# EasyEDA Pro project travellium-12v-desktop-power-supply-cc8d8467.epro, schematic LM5143
Board Name: LM5143; Create Date: 2025-01-03; Page Name: LM5143_SCH; Project Name: 12V桌面电源; Schematic Name: LM5143; Update Date: 2025-03-15; Company: 嘉立创EDA; Page Size: A3; Version: V1.0
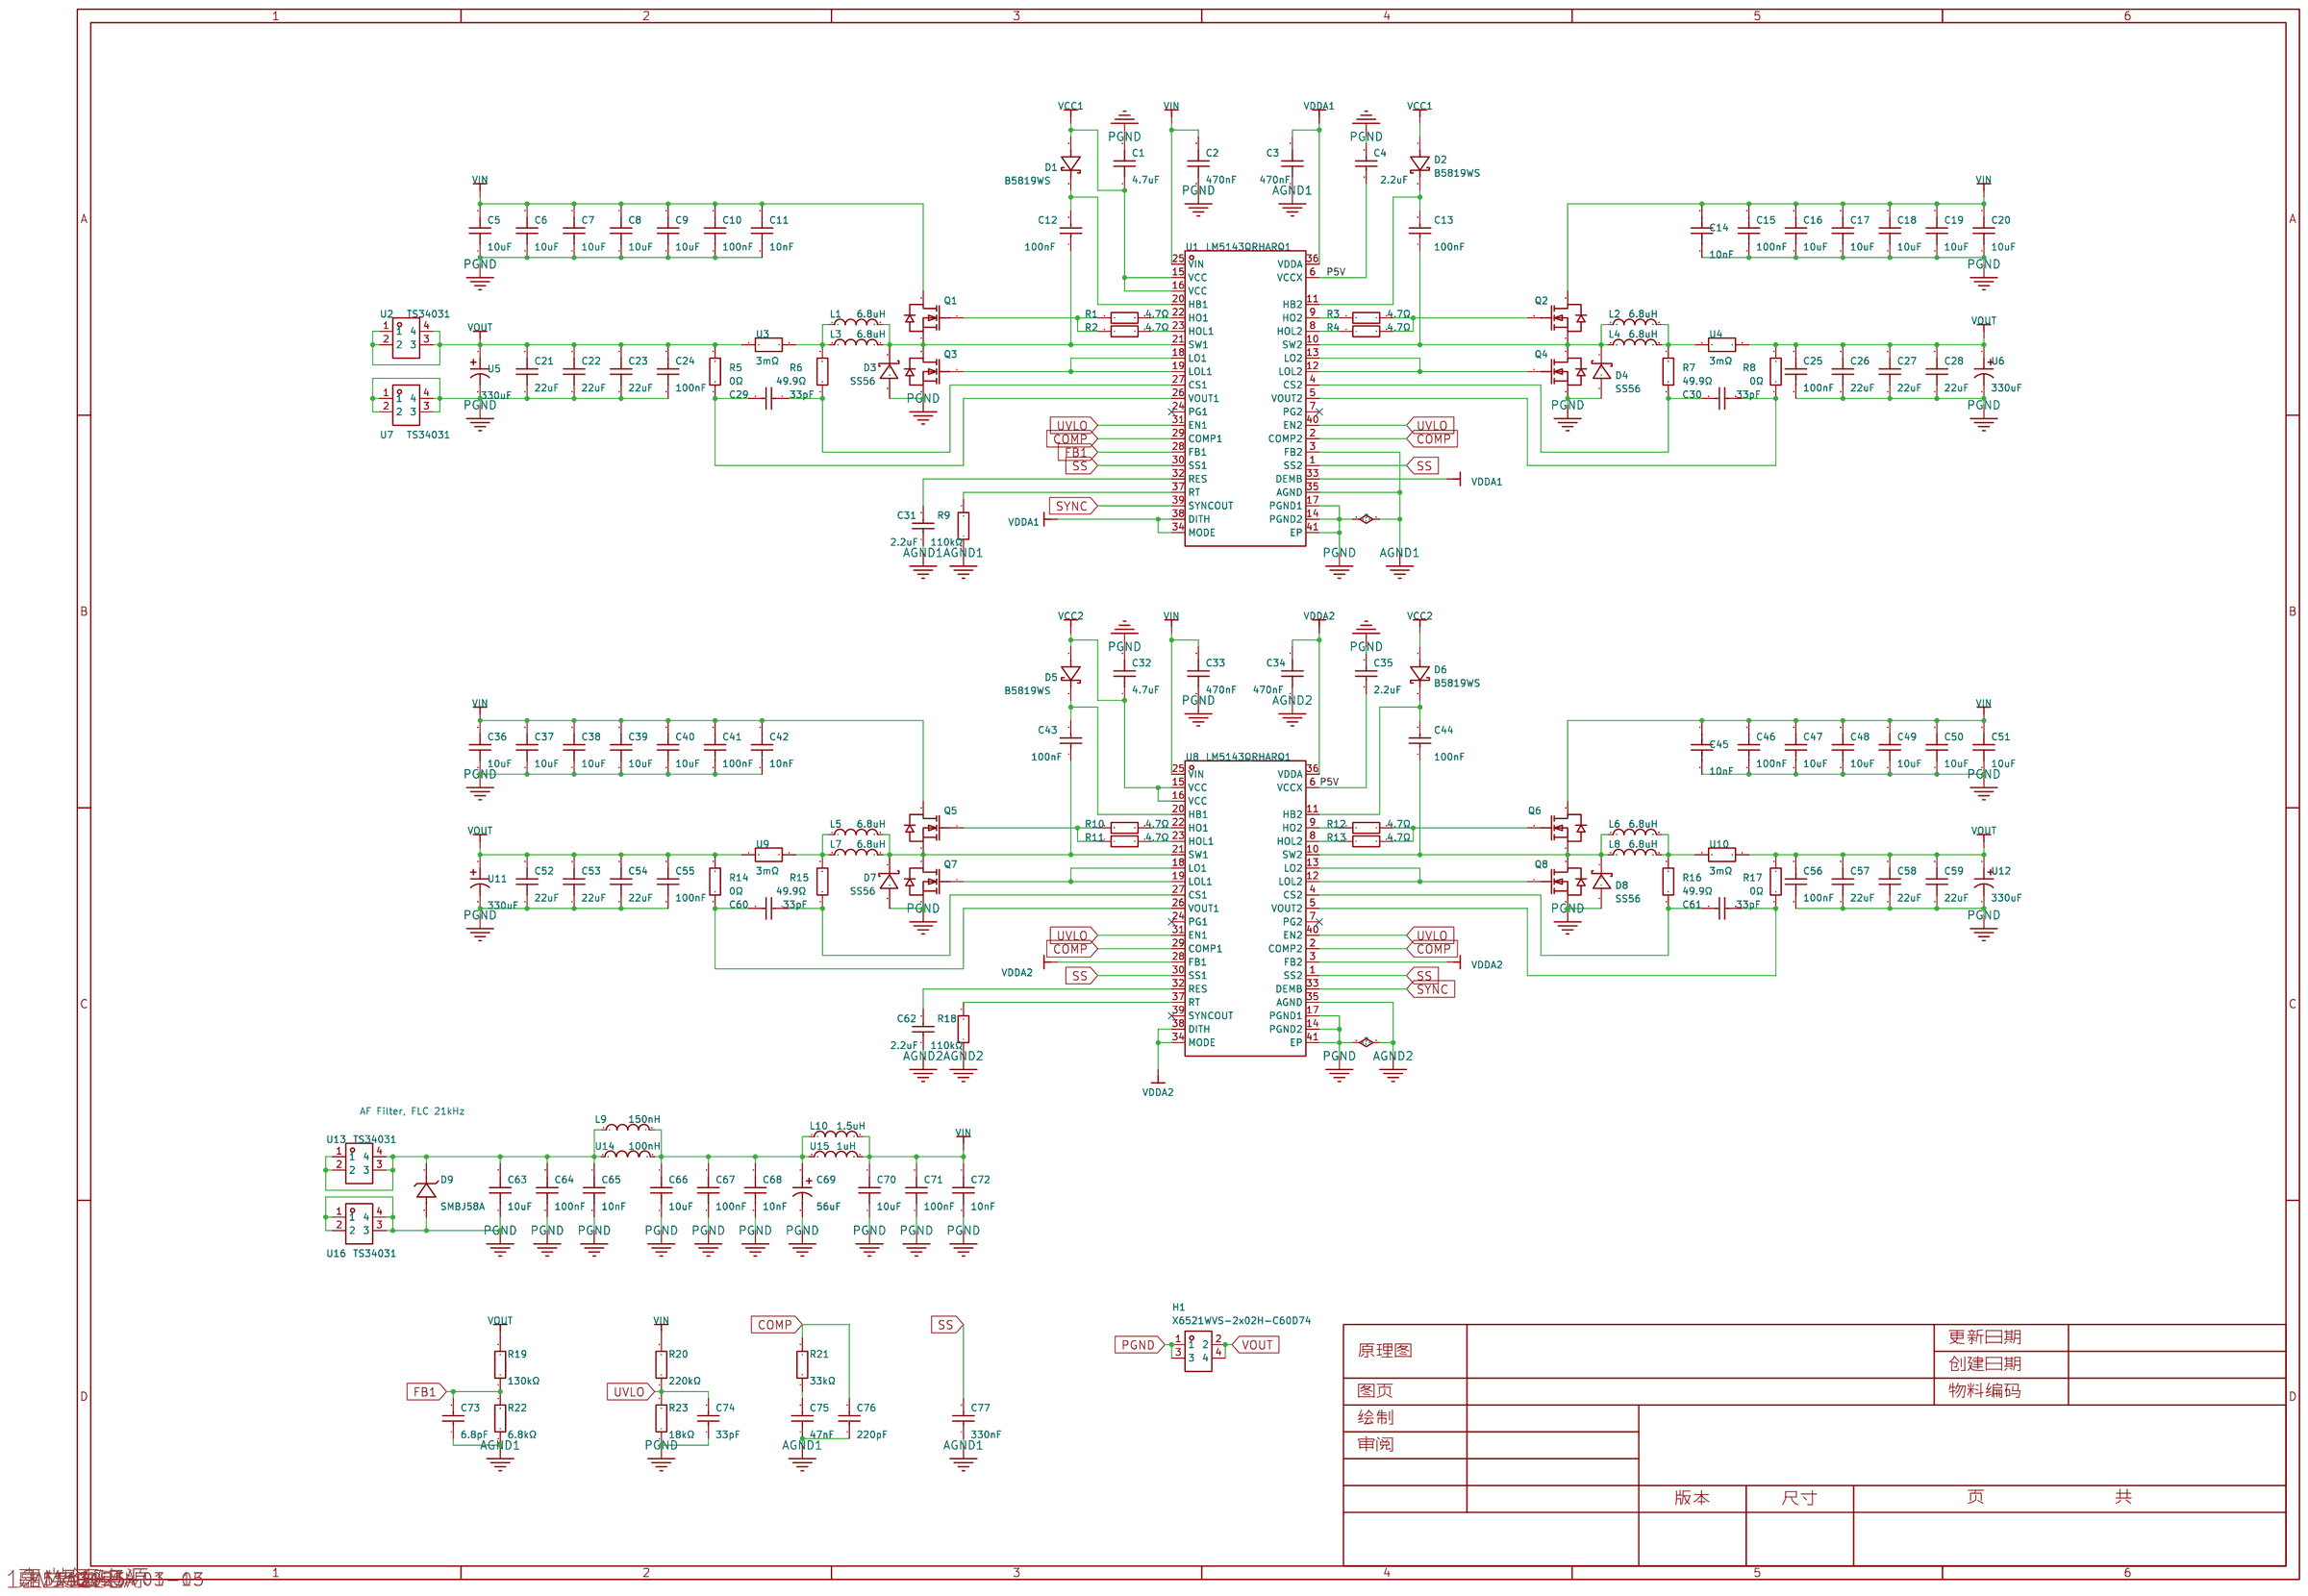
[diagram p3: schematic sheet]

## Parts
C1  4.7uF  [C0603]
C2  470nF  [CAP-SMD_L1.6-W0.8-3]
C3  470nF  [CAP-SMD_L1.6-W0.8-3]
C4  2.2uF  [C0603]
C5  10uF  [C1210]
C6  10uF  [C1210]
C7  10uF  [C1210]
C8  10uF  [C1210]
C9  10uF  [C1210]
C10  100nF  [C0805]
C11  10nF  [C0805]
C12  100nF  [C0603]
C13  100nF  [C0603]
C14  10nF  [C0805]
C15  100nF  [C0805]
C16  10uF  [C1210]
C17  10uF  [C1210]
C18  10uF  [C1210]
C19  10uF  [C1210]
C20  10uF  [C1210]
C21  22uF  [C1210]
C22  22uF  [C1210]
C23  22uF  [C1210]
C24  100nF  [C0805]
C25  100nF  [C0805]
C26  22uF  [C1210]
C27  22uF  [C1210]
C28  22uF  [C1210]
C29  33pF  [C0603]
C30  33pF  [C0603]
C31  2.2uF  [C0603]
C32  4.7uF  [C0603]
C33  470nF  [CAP-SMD_L1.6-W0.8-3]
C34  470nF  [CAP-SMD_L1.6-W0.8-3]
C35  2.2uF  [C0603]
C36  10uF  [C1210]
C37  10uF  [C1210]
C38  10uF  [C1210]
C39  10uF  [C1210]
C40  10uF  [C1210]
C41  100nF  [C0805]
C42  10nF  [C0805]
C43  100nF  [C0603]
C44  100nF  [C0603]
C45  10nF  [C0805]
C46  100nF  [C0805]
C47  10uF  [C1210]
C48  10uF  [C1210]
C49  10uF  [C1210]
C50  10uF  [C1210]
C51  10uF  [C1210]
C52  22uF  [C1210]
C53  22uF  [C1210]
C54  22uF  [C1210]
C55  100nF  [C0805]
C56  100nF  [C0805]
C57  22uF  [C1210]
C58  22uF  [C1210]
C59  22uF  [C1210]
C60  33pF  [C0603]
C61  33pF  [C0603]
C62  2.2uF  [C0603]
C63  10uF  [C1210]
C64  100nF  [C0805]
C65  10nF  [C0805]
C66  10uF  [C1210]
C67  100nF  [C0805]
C68  10nF  [C0805]
C69  56uF  [CAP-SMD_BD10.0-L10.3-W10.3-LS11.0-FD-1]
C70  10uF  [C1210]
C71  100nF  [C0805]
C72  10nF  [C0805]
C73  6.8pF  [C0603]
C74  33pF  [C0603]
C75  47nF  [C0603]
C76  220pF  [C0603]
C77  330nF  [C0603]
D1  B5819WS  [SOD-323_L1.7-W1.3-LS2.5-FD]
D2  B5819WS  [SOD-323_L1.7-W1.3-LS2.5-FD]
D3  SS56  [SMA_L4.3-W2.6-LS5.2-RD]
D4  SS56  [SMA_L4.3-W2.6-LS5.2-RD]
D5  B5819WS  [SOD-323_L1.7-W1.3-LS2.5-FD]
D6  B5819WS  [SOD-323_L1.7-W1.3-LS2.5-FD]
D7  SS56  [SMA_L4.3-W2.6-LS5.2-RD]
D8  SS56  [SMA_L4.3-W2.6-LS5.2-RD]
D9  SMBJ58A  [SMB_L4.4-W3.6-LS5.3-RD]
H1  X6521WVS-2x02H-C60D74  [HDR-SMD_4P-P2.54-V-M-R2-C5-S7.4]
L1  6.8uH  [IND-SMD_L16.5-W15.5]
L2  6.8uH  [IND-SMD_L16.5-W15.5]
L3  6.8uH  [IND-SMD_L23.5-W22.0]
L4  6.8uH  [IND-SMD_L23.5-W22.0]
L5  6.8uH  [IND-SMD_L16.5-W15.5]
L6  6.8uH  [IND-SMD_L16.5-W15.5]
L7  6.8uH  [IND-SMD_L23.5-W22.0]
L8  6.8uH  [IND-SMD_L23.5-W22.0]
L9  150nH  [IND-SMD_L12.8-W8.0_FPIB130840]
L10  1.5uH  [IND-SMD_L17.5-W17.5]
Q1  CSD18563Q5A  [DFN-8_L5.7-W5.1-P1.27-LS6.0-BL]
Q2  CSD18563Q5A  [DFN-8_L5.7-W5.1-P1.27-LS6.0-BL]
Q3  CSD18563Q5A  [DFN-8_L5.7-W5.1-P1.27-LS6.0-BL]
Q4  CSD18563Q5A  [DFN-8_L5.7-W5.1-P1.27-LS6.0-BL]
Q5  CSD18563Q5A  [DFN-8_L5.7-W5.1-P1.27-LS6.0-BL]
Q6  CSD18563Q5A  [DFN-8_L5.7-W5.1-P1.27-LS6.0-BL]
Q7  CSD18563Q5A  [DFN-8_L5.7-W5.1-P1.27-LS6.0-BL]
Q8  CSD18563Q5A  [DFN-8_L5.7-W5.1-P1.27-LS6.0-BL]
R1  4.7Ω  [R0603]
R2  4.7Ω  [R0603]
R3  4.7Ω  [R0603]
R4  4.7Ω  [R0603]
R5  0Ω  [R0603]
R6  49.9Ω  [R0603]
R7  49.9Ω  [R0603]
R8  0Ω  [R0603]
R9  110kΩ  [R0603]
R10  4.7Ω  [R0603]
R11  4.7Ω  [R0603]
R12  4.7Ω  [R0603]
R13  4.7Ω  [R0603]
R14  0Ω  [R0603]
R15  49.9Ω  [R0603]
R16  49.9Ω  [R0603]
R17  0Ω  [R0603]
R18  110kΩ  [R0603]
R19  130kΩ  [R0603]
R20  220kΩ  [R0603]
R21  33kΩ  [R0603]
R22  6.8kΩ  [R0603]
R23  18kΩ  [R0603]
U1  LM5143QRHARQ1  [VQFN-40_L6.0-W6.0-P0.50-TL-EP3.3]
U2  TS34031  [CONN-SMD_TS34031]
U3  3mΩ  [R2512]
U4  3mΩ  [R2512]
U5  330uF  [CAP-SMD_BD10.0-L10.3-W10.3-LS10.9-FD]
U6  330uF  [CAP-SMD_BD10.0-L10.3-W10.3-LS10.9-FD]
U7  TS34031  [CONN-SMD_TS34031]
U8  LM5143QRHARQ1  [VQFN-40_L6.0-W6.0-P0.50-TL-EP3.3]
U9  3mΩ  [R2512]
U10  3mΩ  [R2512]
U11  330uF  [CAP-SMD_BD10.0-L10.3-W10.3-LS10.9-FD]
U12  330uF  [CAP-SMD_BD10.0-L10.3-W10.3-LS10.9-FD]
U13  TS34031  [CONN-SMD_TS34031]
U14  100nH  [IND-SMD_L7.1-W6.6]
U15  1uH  [IND-SMD_L17.5-W17.0_YXMAC1770]
U16  TS34031  [CONN-SMD_TS34031]

## Library data of the parts
C1 C32 = 0603X475K250NT: 容值:4.7uF;精度:±10%;额定电压:25V;材质(温度系数):X5R;; LCSC Part Name: 4.7uF ±10% 25V; Supplier Part: C2936640; Manufacturer: FH(风华); Supplier Footprint: 0603; JLCPCB Part Class: 扩展库; Datasheet: https://atta.szlcsc.com/upload/public/pdf/source/20211229/CBCEA01A18300571AA3BD7304DEDFA2D.pdf; Supplier: LCSC; Tolerance: ±10%; Voltage Rated: 25V; Temperature Coefficient: X5R
C2 C3 C33 C34 = CC0603KRX7R9BB474: 容值:470nF;精度:±10%;额定电压:50V;材质(温度系数):X7R;; LCSC Part Name: 470nF ±10% 50V; Supplier Part: C513577; Manufacturer: YAGEO(国巨); Supplier Footprint: 0603; JLCPCB Part Class: 扩展库; Datasheet: https://atta.szlcsc.com/upload/public/pdf/source/20200423/C519417_FF9998E3F66D767819CD86A66B468321.pdf; Supplier: LCSC; Tolerance: ±10%; Voltage Rated: 50V; Temperature Coefficient: X7R
C4 C31 C35 C62 = 0603B225K250NT: 容值:2.2uF;精度:±10%;额定电压:25V;材质(温度系数):X7R;; LCSC Part Name: 2.2uF ±10% 25V; Supplier Part: C99228; Manufacturer: FH(风华); Supplier Footprint: 0603; JLCPCB Part Class: 扩展库; Datasheet: https://atta.szlcsc.com/upload/public/pdf/source/20200305/C486355_26A10D38EF8C2A5C37091D0039909270.pdf; Supplier: LCSC; Tolerance: ±10%; Voltage Rated: 25V; Temperature Coefficient: X7R
C5-C9 C16-C20 C36-C40 C47-C51 C63 C66 C70 = FS32X106K101EGG: 容值:10uF;精度:±10%;额定电压:100V;材质(温度系数):X7R;; LCSC Part Name: 10uF ±10% 100V; Supplier Part: C5156756; Manufacturer: PSA(信昌电陶); Supplier Footprint: 1210; JLCPCB Part Class: 扩展库; Datasheet: https://atta.szlcsc.com/upload/public/pdf/source/20220906/2A42A90825742552985FFB5A7BAB200E.pdf; Supplier: LCSC; Tolerance: ±10%; Voltage Rated: 100V; Temperature Coefficient: X7R
C10 C15 C24 C25 C41 C46 C55 C56 C64 C67 C71 = 0805B104K101NT: 容值:100nF;精度:±10%;额定电压:100V;材质(温度系数):X7R;; LCSC Part Name: 100nF ±10% 100V; Supplier Part: C89258; Manufacturer: FH(风华); Supplier Footprint: 0805; JLCPCB Part Class: 扩展库; Datasheet: https://atta.szlcsc.com/upload/public/pdf/source/20200305/C486355_26A10D38EF8C2A5C37091D0039909270.pdf; Supplier: LCSC; Tolerance: ±10%; Voltage Rated: 100V; Temperature Coefficient: X7R
C11 C14 C42 C45 C65 C68 C72 = 0805B103K101NT: 容值:10nF;精度:±10%;额定电压:100V;材质(温度系数):X7R;; LCSC Part Name: 10nF ±10% 100V; Supplier Part: C128805; Manufacturer: FH(风华); Supplier Footprint: 0805; JLCPCB Part Class: 扩展库; Datasheet: https://atta.szlcsc.com/upload/public/pdf/source/20200305/C486355_26A10D38EF8C2A5C37091D0039909270.pdf; Supplier: LCSC; Tolerance: ±10%; Voltage Rated: 100V; Temperature Coefficient: X7R
C12 C13 C43 C44 = 0603B104K500NT: 容值:100nF;精度:±10%;额定电压:50V;材质(温度系数):X7R;; LCSC Part Name: 100nF ±10% 50V; Supplier Part: C30926; Manufacturer: FH(风华); Supplier Footprint: 0603; JLCPCB Part Class: 扩展库; Datasheet: https://atta.szlcsc.com/upload/public/pdf/source/20200305/C486355_26A10D38EF8C2A5C37091D0039909270.pdf; Supplier: LCSC; Tolerance: ±10%; Voltage Rated: 50V; Temperature Coefficient: X7R
C21-C23 C26-C28 C52-C54 C57-C59 = CGA1210X5R226K350RT: 容值:22uF;精度:±10%;额定电压:35V;材质(温度系数):X5R;; LCSC Part Name: 22uF ±10% 35V; Supplier Part: C6120016; Manufacturer: HRE(芯声); Supplier Footprint: 1210; JLCPCB Part Class: 扩展库; Datasheet: https://atta.szlcsc.com/upload/public/pdf/source/20240229/B394560356D0E8099C4BF336FC93CE67.pdf; Supplier: LCSC; Tolerance: ±10%; Voltage Rated: 35V; Temperature Coefficient: X5R
C29 C30 C60 C61 C74 = CC0603JRNPO9BN330: 容值:33pF;精度:±5%;额定电压:50V;材质(温度系数):NP0;; LCSC Part Name: 33pF ±5% 50V; Supplier Part: C107047; Manufacturer: YAGEO(国巨); Supplier Footprint: 0603; JLCPCB Part Class: 扩展库; Datasheet: https://atta.szlcsc.com/upload/public/pdf/source/20170914/C128857_1505359892143968080.pdf; Supplier: LCSC; Tolerance: ±5%; Voltage Rated: 50V; Temperature Coefficient: NP0
C69 = HV1J566M1010PZ: 容值:56uF;精度:±20%;额定电压:63V;; LCSC Part Name: 56uF ±20% 63V; Supplier Part: C5246569; Manufacturer: HONOR(荣誉); Supplier Footprint: SMD,D10xL10mm; JLCPCB Part Class: 扩展库; Datasheet: https://atta.szlcsc.com/upload/public/pdf/source/20240802/61683F5000C7CFED5606ABBE3CFBE0F5.pdf; Supplier: LCSC; Tolerance: ±20%; Voltage Rated: 63V; Diameter: 10mm; Height - Seated (Max): 10mm; Operating Temperature: -55℃~+105℃
C73 = 0603CG6R8C500NT: 容值:6.8pF;额定电压:50V;材质(温度系数):C0G;; LCSC Part Name: 6.8pF 50V; Supplier Part: C1679; Manufacturer: FH(风华); Supplier Footprint: 0603; JLCPCB Part Class: 扩展库; Datasheet: https://atta.szlcsc.com/upload/public/pdf/source/20200305/C486355_26A10D38EF8C2A5C37091D0039909270.pdf; Supplier: LCSC; Voltage Rated: 50V; Temperature Coefficient: C0G
C75 = CC0603KRX7R9BB473: 容值:47nF;精度:±10%;额定电压:50V;材质(温度系数):X7R;; LCSC Part Name: 47nF ±10% 50V; Supplier Part: C107093; Manufacturer: YAGEO(国巨); Supplier Footprint: 0603; JLCPCB Part Class: 扩展库; Datasheet: https://atta.szlcsc.com/upload/public/pdf/source/20180910/C282072_33301C7F631E79921B82A8DAC6BCC5B3.pdf; Supplier: LCSC; Tolerance: ±10%; Voltage Rated: 50V; Temperature Coefficient: X7R
C76 = CC0603KRX7R9BB221: 容值:220pF;精度:±10%;额定电压:50V;材质(温度系数):X7R;; LCSC Part Name: 220pF ±10% 50V; Supplier Part: C107081; Manufacturer: YAGEO(国巨); Supplier Footprint: 0603; JLCPCB Part Class: 扩展库; Datasheet: https://atta.szlcsc.com/upload/public/pdf/source/20180910/C282072_33301C7F631E79921B82A8DAC6BCC5B3.pdf; Supplier: LCSC; Tolerance: ±10%; Voltage Rated: 50V; Temperature Coefficient: X7R
C77 = 0603B334K250NT: 容值:330nF;精度:±10%;额定电压:25V;材质(温度系数):X7R;; LCSC Part Name: 330nF ±10% 25V; Supplier Part: C1615; Manufacturer: FH(风华); Supplier Footprint: 0603; JLCPCB Part Class: 扩展库; Datasheet: https://atta.szlcsc.com/upload/public/pdf/source/20200305/C486355_26A10D38EF8C2A5C37091D0039909270.pdf; Supplier: LCSC; Tolerance: ±10%; Voltage Rated: 25V; Temperature Coefficient: X7R
D1 D2 D5 D6 = B5819WS_C7420331: 二极管配置:独立式;正向压降(Vf):600mV@1.0A;直流反向耐压(Vr):40V;整流电流:1A;; LCSC Part Name: 电压:40V 电流:1A; Supplier Part: C7420331; Manufacturer: 宏迦橙; Supplier Footprint: SOD-323; JLCPCB Part Class: 扩展库; Datasheet: https://atta.szlcsc.com/upload/public/pdf/source/20230828/03CA0F4F90DAE368A7153B7B5E4D0651.pdf; Supplier: LCSC; Diode Configuration: 独立式; Forward Voltage (Vf@If): 600mV@1.0A; Reverse Voltage (Vr): 40V; Rectified Current: 1A; Reverse Leakage Current (Ir): 1mA@40V
D3 D4 D7 D8 = SS56_C65009: 二极管配置:独立式;正向压降(Vf):700mV@5A;直流反向耐压(Vr):60V;整流电流:5A;; LCSC Part Name: 电压:60V 电流:5A; Supplier Part: C65009; Manufacturer: MDD(辰达半导体); Supplier Footprint: SMA(DO-214AC); JLCPCB Part Class: 扩展库; Datasheet: https://atta.szlcsc.com/upload/public/pdf/source/20240710/73DFBB65C1883B895E62D589679033DF.pdf; Supplier: LCSC; Diode Configuration: 独立式; Forward Voltage (Vf@If): 700mV@5A; Reverse Voltage (Vr): 60V; Rectified Current: 5A; Reverse Leakage Current (Ir): 1mA@60V
D9 = SMBJ58A_C41376102: 极性:单向;反向截止电压(Vrwm):58V;最大钳位电压:93.6V;峰值脉冲电流(Ipp):6.41A;峰值脉冲功率(Ppp):600W;击穿电压:71.2V;; Supplier Part: C41376102; Manufacturer: 宏嘉诚; Supplier Footprint: SMB; Datasheet: https://atta.szlcsc.com/upload/public/pdf/source/20231129/482485C5E60BCB53F84D553F3B29D8A3.pdf; Supplier: LCSC; polarity: 单向; Reverse Stand-Off Voltage (Vrwm): 58V; Maximum Clamping Voltage: 93.6V; Peak Pulse Current (Ipp): 6.41A; Peak Pulse Power Dissipation (Ppp): 600W; Breakdown Voltage: 71.2V; Reverse Leakage Current (Ir): 5uA; Number of Lines: 单路; Operating Temperature: -55℃~+150℃; Type: TVS
H1 = X6521WVS-2x02H-C60D74: 插针结构:2x2P;间距:2.54mm;行距:2.54mm;圆针/方针:方针;安装类型:-;排数:双排;总PIN位数:4P;额定电流:3A;额定电压:250V;配合针长度:-;塑高:2.5mm;端接针长度:-;触头材质:黄铜;触头镀层:金;工作温度范围:-40℃~+105℃;焊接温度(最大值):260℃;颜色:黑色;; LCSC Part Name: 2x2P 间距:2.54mm 方针; Supplier Part: C780055; Manufacturer: XKB Connection(中国星坤); Supplier Footprint: SMD,P=2.54mm; JLCPCB Part Class: 扩展库; Datasheet: https://atta.szlcsc.com/upload/public/pdf/source/20211009/E3239EE5247E6BAFECB8B74A4FCF9AB8.pdf; Supplier: LCSC; Pin Structure: 2x2P; Pitch: 2.54mm; Row Spacing: 2.54mm; Circluar Pins/Square Pins: 方针; Number of Rows: 双排; Number of Pins: 4P; Current Rating (Max): 3A; Voltage Rating (Max): 250V; Insulation Height: 2.5mm; Contact Material: 黄铜; Contact Plating: 金; Operating Temperature Range: -40℃~+105℃; Soldering Temperature(Max): 260℃; Color: 黑色
L1 L2 L5 L6 = FEXL1513A-6R8M: 电感值:6.8uH;精度:±20%;额定电流:27A;饱和电流(Isat):37A;类型:绕线电感;; LCSC Part Name: 6.8uH ±20% 37A; Supplier Part: C5378600; Manufacturer: cjiang(长江微电); Supplier Footprint: SMD,15.5x16.5mm; JLCPCB Part Class: 扩展库; Datasheet: https://atta.szlcsc.com/upload/public/pdf/source/20240409/B9FA7ECCC3220F3F7C7BE8F7B1FCE238.pdf; Supplier: LCSC; Tolerance: ±20%; Current Rating: 27A; Current - Saturation(Isat): 37A; DC Resistance(DCR): 4.2mΩ; Type: 绕线电感; Ratings: AEC-Q200
L3 L4 L7 L8 = FXL2213-6R8-M: 电感值:6.8uH;精度:±20%;额定电流:36A;饱和电流(Isat):36A;; LCSC Part Name: 6.8uH ±20% 36A; Supplier Part: C22378756; Manufacturer: cjiang(长江微电); Supplier Footprint: SMD,23.5x22mm; JLCPCB Part Class: 扩展库; Datasheet: https://atta.szlcsc.com/upload/public/pdf/source/20240409/B700D7BD239830BF2F6FC389F2DE0EBA.pdf; Supplier: LCSC; Tolerance: ±20%; Rated Current: 36A; Saturation Current (Isat): 36A; DC Resistance (DCR): 3.1mΩ
L9 = FPIB130840-R15M-XA: 电感值:150nH;精度:±20%;额定电流:48A;饱和电流(Isat):90A;类型:一体成型电感;; Supplier Part: C41384226; Manufacturer: cjiang(长江微电); Supplier Footprint: SMD,12.8x8mm; Datasheet: https://atta.szlcsc.com/upload/public/pdf/source/20240910/1953F2102DBFA59DC5E371078F79F7FA.pdf; Supplier: LCSC; Tolerance: ±20%; Current Rating: 48A; Current - Saturation(Isat): 90A; DC Resistance(DCR): 600mΩ; Type: 一体成型电感
L10 = CKST1707-1.5uH/M: 电感值:1.5uH;精度:±20%;额定电流:35A;饱和电流(Isat):40A;类型:一体成型电感;; Manufacturer: CENKER(岑科); Supplier: LCSC; Supplier Part: C3002739; LCSC Part Name: 1.5uH ±20% 40A; Supplier Footprint: SMD,17.5x17.5mm; Datasheet: https://item.szlcsc.com/datasheet/CKST1707-1.5uH%252FM/3488246.html; Tolerance: ±20%; Rated Current: 35A; Saturation Current (Isat): 40A; DC Resistance (DCR): 2.8mΩ; Type: 一体成型电感
Q1-Q8 = CSD18563Q5A: 类型:1个N沟道;漏源电压(Vdss):60V;连续漏极电流(Id):100A;导通电阻(RDS(on)@Vgs,Id):5.7mΩ@10V,18A;功率(Pd):116W;阈值电压(Vgs(th)@Id):2V@250uA;; LCSC Part Name: 1个N沟道 耐压:60V 电流:100A; Supplier Part: C77239; Manufacturer: TI(德州仪器); Supplier Footprint: DFN-8(5.1x5.7); JLCPCB Part Class: 扩展库; Datasheet: https://www.ti.com/cn/lit/gpn/csd18563q5a; Supplier: LCSC; Type: 1个N沟道; Drain Source Voltage (Vdss): 60V; Continuous Drain Current (Id): 100A; Drain Source On Resistance (RDS(on)@Vgs,Id): 5.7mΩ@10V,18A; Power Dissipation (Pd): 116W; Gate Threshold Voltage (Vgs(th)@Id): 2V@250uA; Total Gate Charge (Qg@Vgs): 15nC@10V; Input Capacitance (Ciss@Vds): 1.5nF@30V; Reverse Transfer Capacitance (Crss@Vds): 5.1pF@30V; Operating Temperature: -55℃~+150℃
R1-R4 R10-R13 = 0603WAF470KT5E: 电阻类型:厚膜电阻;阻值:4.7Ω;精度:±1%;功率:100mW;最大工作电压:75V;温度系数:±400ppm/℃;; LCSC Part Name: 4.7Ω ±1% 100mW 厚膜电阻; Supplier Part: C23164; Manufacturer: UNI-ROYAL(厚声); Supplier Footprint: 0603; JLCPCB Part Class: 基础库; Datasheet: https://atta.szlcsc.com/upload/public/pdf/source/20200306/C422600_1E6D84923E4A46A82E41ADD87F860B5C.pdf; Supplier: LCSC; Type: 厚膜电阻; Tolerance: ±1%; Power(Watts): 100mW; Overload Voltage (Max): 75V; Temperature Coefficient: ±400ppm/℃; Operating Temperature Range: -55℃~+155℃
R5 R8 R14 R17 = 0603WAF0000T5E: 电阻类型:厚膜电阻;阻值:0Ω;精度:±1%;功率:100mW;最大工作电压:75V;; LCSC Part Name: 0Ω ±1% 100mW 厚膜电阻; Supplier Part: C21189; Manufacturer: UNI-ROYAL(厚声); Supplier Footprint: 0603; Datasheet: https://atta.szlcsc.com/upload/public/pdf/source/20200306/C422600_1E6D84923E4A46A82E41ADD87F860B5C.pdf; Supplier: LCSC; Type: 厚膜电阻; Tolerance: ±1%; Power(Watts): 100mW; Overload Voltage (Max): 75V; Operating Temperature Range: -55℃~+155℃
R6 R7 R15 R16 = 0603WAF499JT5E: 电阻类型:厚膜电阻;阻值:49.9Ω;精度:±1%;功率:100mW;最大工作电压:75V;温度系数:±100ppm/℃;; LCSC Part Name: 49.9Ω ±1% 100mW 厚膜电阻; Supplier Part: C23185; Manufacturer: UNI-ROYAL(厚声); Supplier Footprint: 0603; JLCPCB Part Class: 基础库; Datasheet: https://atta.szlcsc.com/upload/public/pdf/source/20200306/C422600_1E6D84923E4A46A82E41ADD87F860B5C.pdf; Supplier: LCSC; Type: 厚膜电阻; Tolerance: ±1%; Power(Watts): 100mW; Overload Voltage (Max): 75V; Temperature Coefficient: ±100ppm/℃; Operating Temperature Range: -55℃~+155℃
R9 R18 = 0603WAF1103T5E: 电阻类型:厚膜电阻;阻值:110kΩ;精度:±1%;功率:100mW;最大工作电压:75V;温度系数:±100ppm/℃;; LCSC Part Name: 110kΩ ±1% 100mW 厚膜电阻; Supplier Part: C25805; Manufacturer: UNI-ROYAL(厚声); Supplier Footprint: 0603; JLCPCB Part Class: 扩展库; Datasheet: https://atta.szlcsc.com/upload/public/pdf/source/20200306/C422600_1E6D84923E4A46A82E41ADD87F860B5C.pdf; Supplier: LCSC; Type: 厚膜电阻; Tolerance: ±1%; Power(Watts): 100mW; Overload Voltage (Max): 75V; Temperature Coefficient: ±100ppm/℃; Operating Temperature Range: -55℃~+155℃
R19 = 0603WAF1303T5E: 电阻类型:厚膜电阻;阻值:130kΩ;精度:±1%;功率:100mW;最大工作电压:75V;温度系数:±100ppm/℃;; LCSC Part Name: 130kΩ ±1% 100mW 厚膜电阻; Supplier Part: C22795; Manufacturer: UNI-ROYAL(厚声); Supplier Footprint: 0603; Datasheet: https://atta.szlcsc.com/upload/public/pdf/source/20200306/C422600_1E6D84923E4A46A82E41ADD87F860B5C.pdf; Supplier: LCSC; Type: 厚膜电阻; Tolerance: ±1%; Power(Watts): 100mW; Overload Voltage (Max): 75V; Temperature Coefficient: ±100ppm/℃; Operating Temperature Range: -55℃~+155℃
R20 = 0603WAF2203T5E: 电阻类型:厚膜电阻;阻值:220kΩ;精度:±1%;功率:100mW;最大工作电压:75V;温度系数:±100ppm/℃;; LCSC Part Name: 220kΩ ±1% 100mW 厚膜电阻; Supplier Part: C22961; Manufacturer: UNI-ROYAL(厚声); Supplier Footprint: 0603; JLCPCB Part Class: 基础库; Datasheet: https://atta.szlcsc.com/upload/public/pdf/source/20200306/C422600_1E6D84923E4A46A82E41ADD87F860B5C.pdf; Supplier: LCSC; Type: 厚膜电阻; Tolerance: ±1%; Power(Watts): 100mW; Overload Voltage (Max): 75V; Temperature Coefficient: ±100ppm/℃; Operating Temperature Range: -55℃~+155℃
R21 = 0603WAF3302T5E: 电阻类型:厚膜电阻;阻值:33kΩ;精度:±1%;功率:100mW;最大工作电压:75V;温度系数:±100ppm/℃;; LCSC Part Name: 33kΩ ±1% 100mW 厚膜电阻; Supplier Part: C4216; Manufacturer: UNI-ROYAL(厚声); Supplier Footprint: 0603; Datasheet: https://atta.szlcsc.com/upload/public/pdf/source/20200306/C422600_1E6D84923E4A46A82E41ADD87F860B5C.pdf; Supplier: LCSC; Type: 厚膜电阻; Tolerance: ±1%; Power(Watts): 100mW; Overload Voltage (Max): 75V; Temperature Coefficient: ±100ppm/℃; Operating Temperature Range: -55℃~+155℃
R22 = 0603WAF6801T5E: 电阻类型:厚膜电阻;阻值:6.8kΩ;精度:±1%;功率:100mW;最大工作电压:75V;温度系数:±100ppm/℃;; LCSC Part Name: 6.8kΩ ±1% 100mW 厚膜电阻; Supplier Part: C23212; Manufacturer: UNI-ROYAL(厚声); Supplier Footprint: 0603; Datasheet: https://atta.szlcsc.com/upload/public/pdf/source/20200306/C422600_1E6D84923E4A46A82E41ADD87F860B5C.pdf; Supplier: LCSC; Type: 厚膜电阻; Tolerance: ±1%; Power(Watts): 100mW; Overload Voltage (Max): 75V; Temperature Coefficient: ±100ppm/℃; Operating Temperature Range: -55℃~+155℃
R23 = 0603WAF1802T5E: 电阻类型:厚膜电阻;阻值:18kΩ;精度:±1%;功率:100mW;最大工作电压:75V;温度系数:±100ppm/℃;; LCSC Part Name: 18kΩ ±1% 100mW 厚膜电阻; Supplier Part: C25810; Manufacturer: UNI-ROYAL(厚声); Supplier Footprint: 0603; Datasheet: https://atta.szlcsc.com/upload/public/pdf/source/20200306/C422600_1E6D84923E4A46A82E41ADD87F860B5C.pdf; Supplier: LCSC; Type: 厚膜电阻; Tolerance: ±1%; Power(Watts): 100mW; Overload Voltage (Max): 75V; Temperature Coefficient: ±100ppm/℃; Operating Temperature Range: -55℃~+155℃
U1 U8 = LM5143QRHARQ1: 功能类型:降压型;输入电压:3.5V~65V;输出电压:600mV~55V;输出电流:40A;; Supplier Part: C5219258; Manufacturer: TI(德州仪器); Supplier Footprint: VQFN-40(6x6); JLCPCB Part Class: 扩展库; Datasheet: https://www.ti.com/cn/lit/gpn/lm5143a-q1; Supplier: LCSC; Function: 降压型; Input Voltage: 3.5V~65V; Output Voltage: 600mV~55V; Output Current: 40A; Switching Frequency: 2.2MHz; Operating Temperature: -40℃~+150℃; Synchronous Rectification: 是; Number of Outputs: 2; Topology: 降压式; Quiescent Current (Iq): 15uA; Switch tube (built-in/external): 内置
U2 U7 U13 U16 = TS34031: LCSC Part Name: 四脚 M3 二件套; Supplier Part: C481441; Manufacturer: XFCN(兴飞); Supplier Footprint: SMD; Datasheet: https://atta.szlcsc.com/upload/public/pdf/source/20240702/F73D6C2A31E01780573F167639CEBCF1.pdf; Supplier: LCSC
U3 U4 U9 U10 = HoYLR2512-3W-3mR-1%: 电阻类型:采样电阻;阻值:3mΩ;精度:±1%;功率:3W;安装方式:贴片;; LCSC Part Name: 3mΩ ±1% 3W; Supplier Part: C5375459; Manufacturer: Milliohm(毫欧); Supplier Footprint: 2512; JLCPCB Part Class: 扩展库; Datasheet: https://atta.szlcsc.com/upload/public/pdf/source/20230410/281FB57F2A31C64FD07DBC5FCC932F0E.pdf; Supplier: LCSC; Type: 采样电阻; Tolerance: ±1%; Power(Watts): 3W; Mounting Sytle: 贴片
U5 U6 U11 U12 = HV1V337M1010PZ: 容值:330uF;精度:±20%;额定电压:35V;; LCSC Part Name: 330uF ±20% 35V; Supplier Part: C5246558; Manufacturer: HONOR(荣誉); Supplier Footprint: SMD,D10xL10mm; JLCPCB Part Class: 扩展库; Datasheet: https://atta.szlcsc.com/upload/public/pdf/source/20240802/61683F5000C7CFED5606ABBE3CFBE0F5.pdf; Supplier: LCSC; Tolerance: ±20%; Rated Voltage: 35V; φD: 10mm; L: 10mm; Operating Temperature: -55℃~+105℃
U14 = 0630CDMCCDS-R10MC: 电感值:100nH;精度:±20%;额定电流:40A;饱和电流(Isat):61.2A;类型:-;; LCSC Part Name: 100nH ±20% 61.2A; Supplier Part: C2595953; Manufacturer: Sumida(胜美达); Supplier Footprint: 2726; Datasheet: https://atta.szlcsc.com/upload/public/pdf/source/20210415/57418337624D798EDEE38BA09EF4FF72.pdf; Supplier: LCSC; Tolerance: ±20%; Rated Current: 40A; Saturation Current (Isat): 61.2A; DC Resistance (DCR): 0.9mΩ
U15 = XR1770-1R0M: 电感值:1uH;精度:±20%;额定电流:45A;饱和电流(Isat):54A;类型:一体成型电感;; LCSC Part Name: 1uH ±20% 54A; Supplier Part: C7498876; Manufacturer: XR(祥如); Supplier Footprint: SMD,17x17.5mm; Datasheet: https://atta.szlcsc.com/upload/public/pdf/source/20230809/5CE8440EBC596AA27ED878D46769EF69.pdf; Supplier: LCSC; Tolerance: ±20%; Rated Current: 45A; Saturation Current (Isat): 54A; DC Resistance (DCR): 1.45mΩ; Type: 一体成型电感

## Nets
AGND1: C1.2 C2.1 C3.1 C4.2 C5.1 C6.1 C7.1 C8.1 C9.1 C10.1 C11.2 C14.2 C15.1 C16.1 C17.1 C18.1 C19.1 C20.1 C21.1 C22.1 C23.1 C24.1 C25.1 C26.1 C27.1 C28.1 C31.1 C32.2 C33.1 C34.1 C35.2 C36.1 C37.1 C38.1 C39.1 C40.1 C41.1 C42.2 C45.2 C46.1 C47.1 C48.1 C49.1 C50.1 C51.1 C52.1 C53.1 C54.1 C55.1 C56.1 C57.1 C58.1 C59.1 C62.1 C63.1 C64.1 C65.2 C66.1 C67.1 C68.2 C69.2 C70.1 C71.1 C72.2 C73.1 C74.1 C75.1 C76.1 C77.1 D3.2(A) D4.2(A) D7.2(A) D8.2(A) D9.2(A) H1.1 H1.3 Q3.2(S) Q4.2(S) Q7.2(S) Q8.2(S) R9.1 R18.1 R22.1 R23.1 U1.3(FB2) U1.14(PGND2) U1.17(PGND1) U1.35(AGND) U1.41(EP) U5.2 U6.2 U7.1 U7.2 U7.3 U7.4 U8.14(PGND2) U8.17(PGND1) U8.35(AGND) U8.41(EP) U11.2 U12.2 U16.1 U16.2 U16.3 U16.4
P5V: C4.1 C35.1 U1.6(VCCX) U8.6(VCCX)
VCC1: C1.1 D1.1(A) D2.1(A) U1.15(VCC) U1.16(VCC)
VCC2: C32.1 D5.1(A) D6.1(A) U8.15(VCC) U8.16(VCC)
VDDA1: C3.2 U1.33(DEMB) U1.34(MODE) U1.36(VDDA) U1.38(DITH)
VDDA2: C34.2 U8.3(FB2) U8.28(FB1) U8.34(MODE) U8.36(VDDA) U8.38(DITH)
VIN: C2.2 C5.2 C6.2 C7.2 C8.2 C9.2 C10.2 C11.1 C14.1 C15.2 C16.2 C17.2 C18.2 C19.2 C20.2 C33.2 C36.2 C37.2 C38.2 C39.2 C40.2 C41.2 C42.1 C45.1 C46.2 C47.2 C48.2 C49.2 C50.2 C51.2 C70.2 C71.2 C72.1 L10.2 Q1.3(D) Q2.3(D) Q5.3(D) Q6.3(D) R20.2 U1.25(VIN) U8.25(VIN) U15.2
COMP: C76.2 R21.2 U1.2(COMP2) U1.29(COMP1) U8.2(COMP2) U8.29(COMP1)
FB1: C73.2 R19.1 R22.2 U1.28(FB1)
SS: C77.2 U1.1(SS2) U1.30(SS1) U8.1(SS2) U8.30(SS1)
SYNC: U1.39(SYNCOUT) U8.33(DEMB)
UVLO: C74.2 R20.1 R23.2 U1.31(EN1) U1.40(EN2) U8.31(EN1) U8.40(EN2)
VOUT: C21.2 C22.2 C23.2 C24.2 C25.2 C26.2 C27.2 C28.2 C52.2 C53.2 C54.2 C55.2 C56.2 C57.2 C58.2 C59.2 H1.2 H1.4 R5.2 R8.2 R14.2 R17.2 R19.2 U2.1 U2.2 U2.3 U2.4 U3.1 U4.2 U5.1 U6.1 U9.1 U10.2 U11.1 U12.1
$1N6081: C13.2 D2.2(K) U1.11(HB2)
$1N6213: R3.1 U1.9(HO2)
$1N6253: R4.1 U1.8(HOL2)
$1N6292: Q2.1(G) R3.2 R4.2
$1N7708: Q4.1(G) U1.12(LOL2) U1.13(LO2)
$1N8083: C30.2 R8.1 U1.5(VOUT2)
$1N8088: C30.1 R7.1 U1.4(CS2)
$1N9456: L1.1 L3.2 R6.2 U3.2
$1N9460: C29.2 R5.1 U1.26(VOUT1)
$1N9467: C29.1 R6.1 U1.27(CS1)
$1N9476: C12.1 D3.1(K) L1.2 L3.1 Q1.2(S) Q3.3(D) U1.21(SW1)
$1N9481: Q3.1(G) U1.18(LO1) U1.19(LOL1)
$1N9486: Q1.1(G) R1.1 R2.1
$1N9487: R2.2 U1.23(HOL1)
$1N9488: R1.2 U1.22(HO1)
$1N9489: C12.2 D1.2(K) U1.20(HB1)
$1N12644: C31.2 U1.32(RES)
$1N12652: R9.2 U1.37(RT)
$1N20860: C66.2 C67.2 C68.1 C69.1 L9.2 L10.1 U14.2 U15.1
$1N28880: L2.2 L4.2 R7.2 U4.1
$1N28888: C13.1 D4.1(K) L2.1 L4.1 Q2.2(S) Q4.3(D) U1.10(SW2)
$1N41051: C63.2 C64.2 C65.1 D9.1(C) L9.1 U13.1 U13.2 U13.3 U13.4 U14.1
$1N44338: C44.2 D6.2(K) U8.11(HB2)
$1N44340: R12.1 U8.9(HO2)
$1N44341: R13.1 U8.8(HOL2)
$1N44342: C44.1 D8.1(K) L6.1 L8.1 Q6.2(S) Q8.3(D) U8.10(SW2)
$1N44343: Q6.1(G) R12.2 R13.2
$1N44347: Q8.1(G) U8.12(LOL2) U8.13(LO2)
$1N44348: C61.2 R17.1 U8.5(VOUT2)
$1N44349: C61.1 R16.1 U8.4(CS2)
$1N44352: C43.2 D5.2(K) U8.20(HB1)
$1N44353: R10.2 U8.22(HO1)
$1N44354: R11.2 U8.23(HOL1)
$1N44355: Q5.1(G) R10.1 R11.1
$1N44358: L5.1 L7.2 R15.2 U9.2
$1N44361: Q7.1(G) U8.18(LO1) U8.19(LOL1)
$1N44363: C60.2 R14.1 U8.26(VOUT1)
$1N44364: C60.1 R15.1 U8.27(CS1)
$1N44365: C43.1 D7.1(K) L5.2 L7.1 Q5.2(S) Q7.3(D) U8.21(SW1)
$1N44377: C62.2 U8.32(RES)
$1N44378: R18.2 U8.37(RT)
$1N44386: L6.2 L8.2 R16.2 U10.1
$1N82741: C75.2 R21.1

Not connected (* = marked no-connect by the designer): U1 7(PG2)* 24(PG1)*; U8 7(PG2)* 24(PG1)* 39(SYNCOUT)*

## Notes on the sheet
- AF Filter, FLC 21kHz
